# Altium schematic sheet XilinxPower.SchDoc
size A3; Organization: Altium Limited; Address1: L3, 12a Rodborough Rd; Address2: Frenchs Forest; Address3: NSW; Address4: Australia 2086
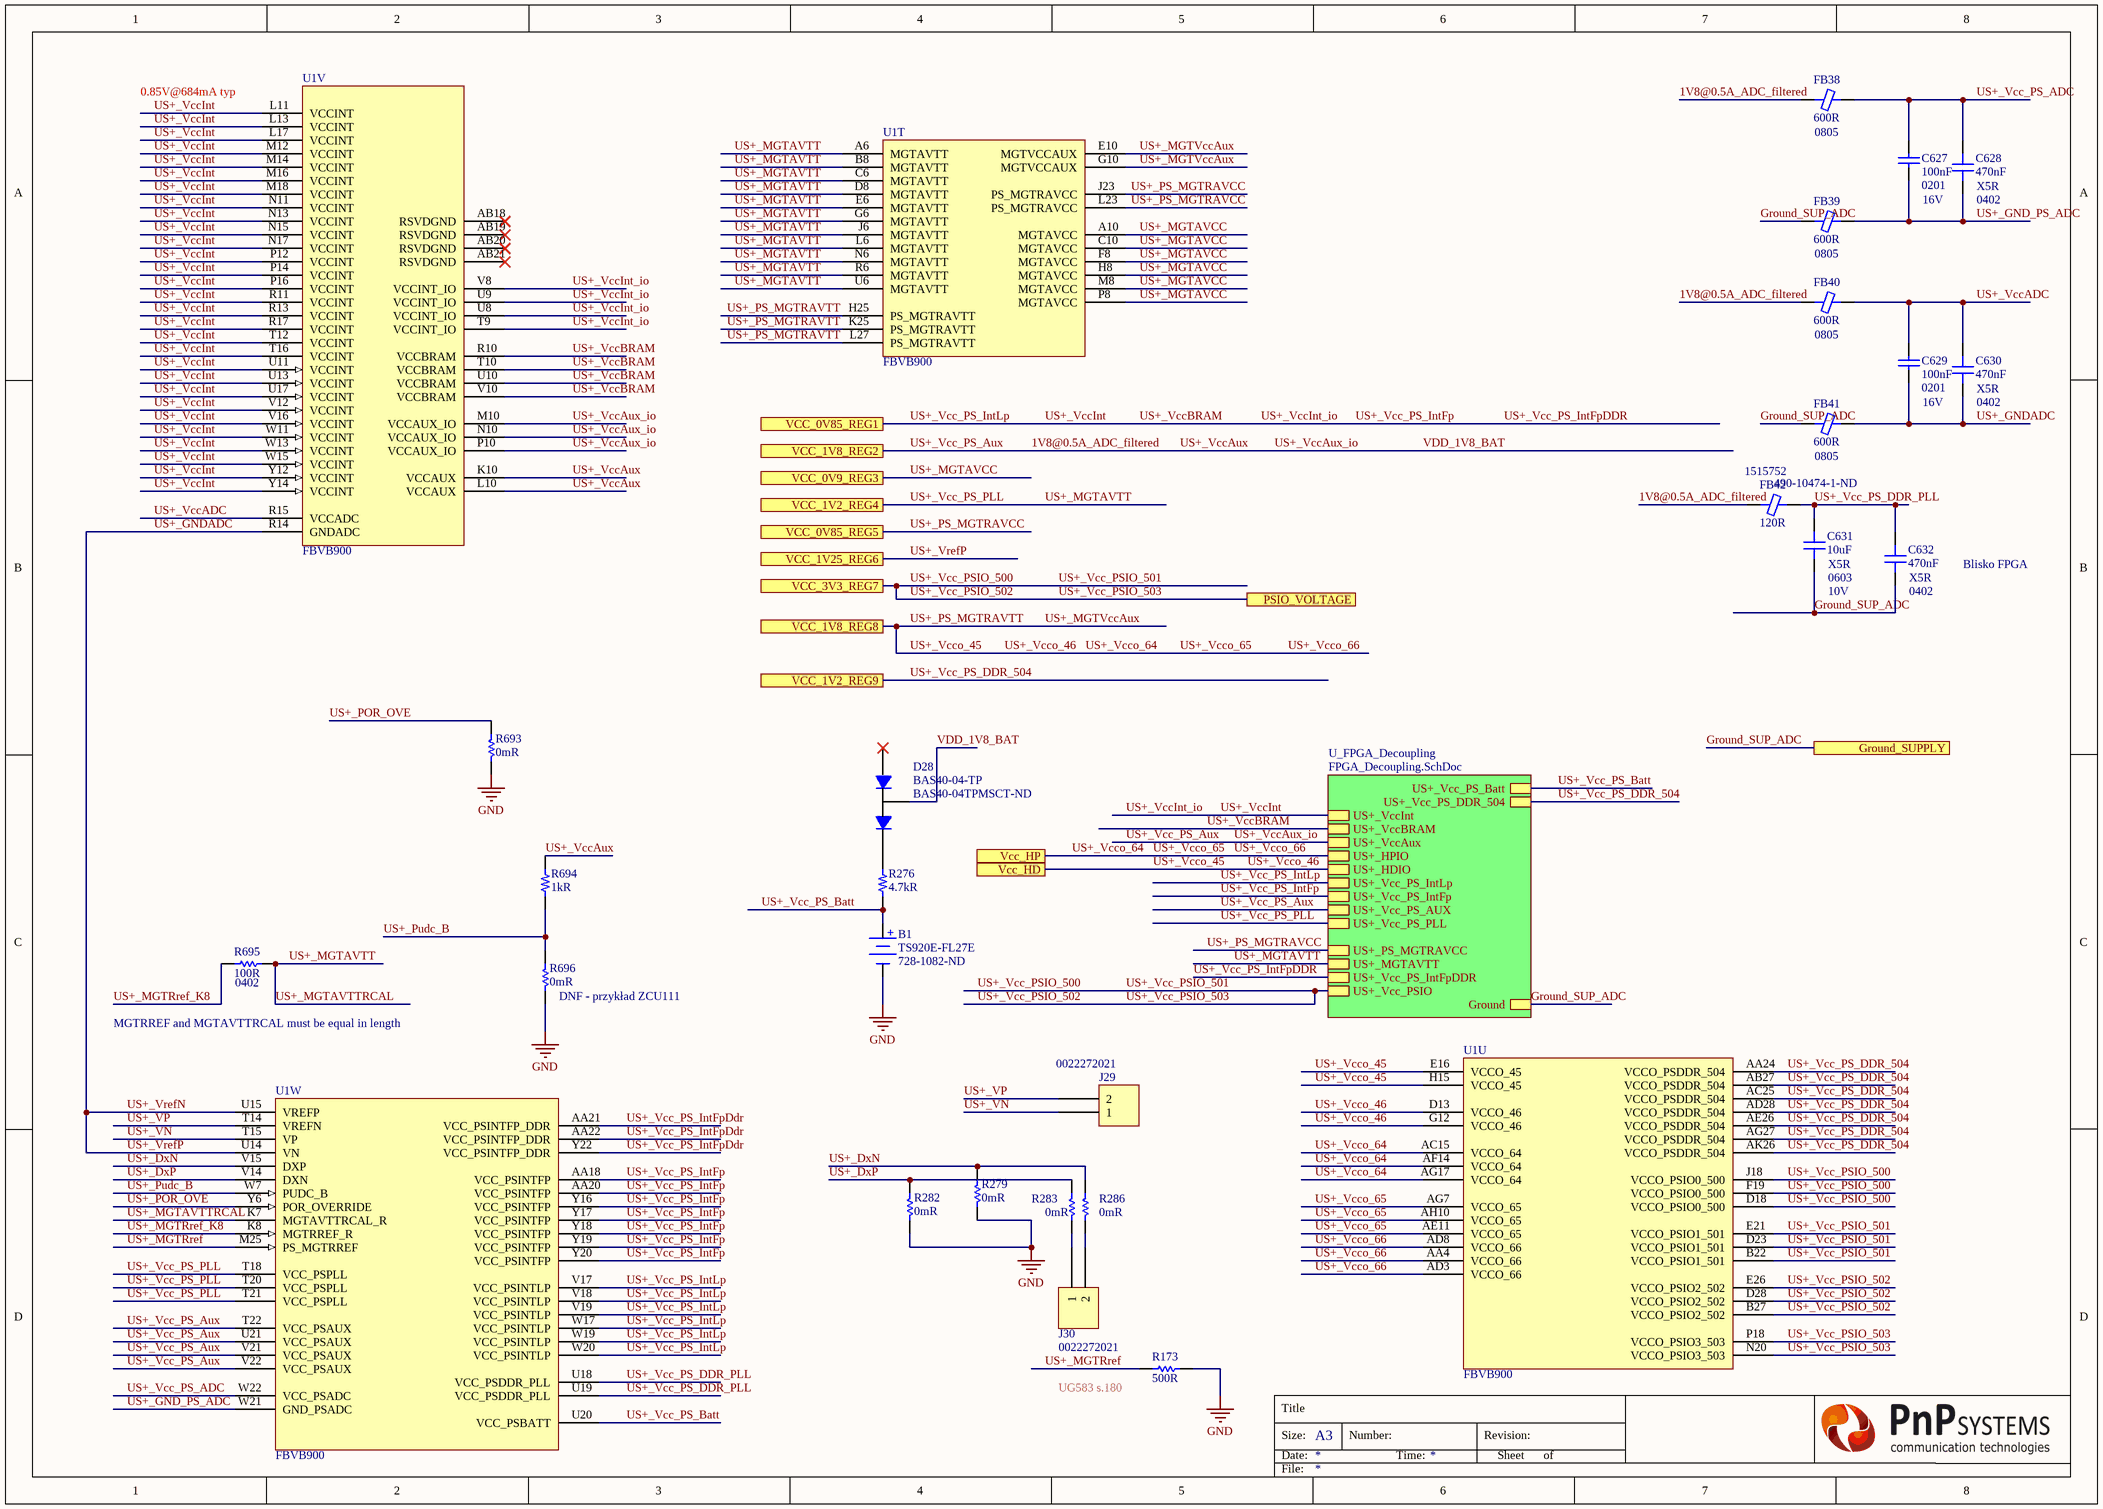
[diagram p0: XilinxPower.SchDoc]

## Parts
B1  TS920E-FL27E  Supplier Part Number 1: 728-1082-ND  [Battery]
C627  100nF  Case/Package: 0201  Voltage Rating: 16V  [CAP 0201/0603 KK]
C628  470nF  Case/Package: 0402  Dielectric: X5R  [CAP 0402/1005 KK]
C629  100nF  Case/Package: 0201  Voltage Rating: 16V  [CAP 0201/0603 KK]
C630  470nF  Case/Package: 0402  Dielectric: X5R  [CAP 0402/1005 KK]
C631  10uF  Supplier Part Number 1: 490-10474-1-ND  Case/Package: 0603  Dielectric: X5R  Voltage Rating: 10V  [CAP 0603/1608 RF]
C632  470nF  Case/Package: 0402  Dielectric: X5R  [CAP 0402/1005 KK]
D28  BAS40-04-TP  Supplier Part Number 1: BAS40-04TPMSCT-ND  [BAS40-04-TP]
FB38  600R  Case/Package: 0805  [FER 0805/2012]
FB39  600R  Case/Package: 0805  [FER 0805/2012]
FB40  600R  Case/Package: 0805  [FER 0805/2012]
FB41  600R  Case/Package: 0805  [FER 0805/2012]
FB42  120R  Supplier Part Number 1: 1515752  [FER 0603/1608]
J29  Supplier Part Number 1: 0022272021  [MOLEX KK 0022272021]  (hidden comment: SYSMON_VP_VN)
J30  Supplier Part Number 1: 0022272021  [MOLEX KK 0022272021]  (hidden comment: SYSMON_VP_VN)
R173  500R  [RES 0402/1005 RF KK]
R276  4.7kR  [RES 0402/1005 RF KK]
R279  0mR  [RES 0402/1005 RF KK]
R282  0mR  [RES 0402/1005 RF KK]
R283  0mR  [RES 0402/1005 RF KK]
R286  0mR  [RES 0402/1005 RF KK]
R693  0mR  [RES 0402/1005 RF KK]
R694  1kR  [RES 0402/1005 RF KK]
R695  100R  Case/Package: 0402  [RES 0402/1005 RF KK]
R696  0mR  [RES 0402/1005 RF KK]
U1  FBVB900  [FBVB900 XX]  (parts T,U,V,W of 23)

## Sub-sheets
U_FPGA_Decoupling = FPGA_Decoupling.SchDoc: US+_VccInt, US+_VccBRAM, Ground, US+_VccAux, US+_HPIO, US+_HDIO, US+_Vcc_PS_IntLp, US+_PS_MGTRAVCC, US+_MGTAVTT, US+_Vcc_PS_IntFp, US+_Vcc_PS_AUX, US+_Vcc_PS_PLL, US+_Vcc_PSIO, US+_Vcc_PS_Batt, US+_Vcc_PS_DDR_504, US+_Vcc_PS_IntFpDDR

## Ports
Ground_SUPPLY, PSIO_VOLTAGE, VCC_0V9_REG3, VCC_0V85_REG1, VCC_0V85_REG5, VCC_1V2_REG4, VCC_1V2_REG9, VCC_1V8_REG2, VCC_1V8_REG8, VCC_1V25_REG6, VCC_3V3_REG7, Vcc_HD, Vcc_HP

## Nets
GND: B1.2(-) R173.2 R279.2 R282.2 R693.2 R696.2
1V8@0.5A_ADC_filtered: D28.3 FB38.1 FB40.1 FB42.1 R694.1 U1.K10(VCCAUX) U1.L10(VCCAUX) U1.M10(VCCAUX_IO) U1.N10(VCCAUX_IO) U1.P10(VCCAUX_IO) U1.T22(VCC_PSAUX) U1.U21(VCC_PSAUX) U1.V21(VCC_PSAUX) U1.V22(VCC_PSAUX) ; port VCC_1V8_REG2, sheet U_FPGA_Decoupling/US+_VccAux, sheet U_FPGA_Decoupling/US+_Vcc_PS_AUX  [also labelled US+_Vcc_PS_Aux, US+_VccAux, US+_VccAux_io, VDD_1V8_BAT]
Ground_SUP_ADC: C631.1 C632.1 FB39.1 FB41.1 ; port Ground_SUPPLY, sheet U_FPGA_Decoupling/Ground
US+_DxN: R279.1 R286.1 U1.V15(DXP)
US+_DxP: R282.1 R283.1 U1.V14(DXN)
US+_GND_PS_ADC: C627.1 C628.1 FB39.2 U1.W21(GND_PSADC)
US+_GNDADC: C629.1 C630.1 FB41.2 U1.R14(GNDADC) U1.U14(VN) U1.U15(VREFP) ; port VCC_1V25_REG6  [also labelled US+_VrefN, US+_VrefP]
US+_MGTAVCC: U1.A10(MGTAVCC) U1.C10(MGTAVCC) U1.F8(MGTAVCC) U1.H8(MGTAVCC) U1.M8(MGTAVCC) U1.P8(MGTAVCC) ; port VCC_0V9_REG3
US+_MGTAVTT: R695.2 U1.A6(MGTAVTT) U1.B8(MGTAVTT) U1.C6(MGTAVTT) U1.D8(MGTAVTT) U1.E6(MGTAVTT) U1.G6(MGTAVTT) U1.J6(MGTAVTT) U1.K7(MGTAVTTRCAL_R) U1.L6(MGTAVTT) U1.N6(MGTAVTT) U1.R6(MGTAVTT) U1.T18(VCC_PSPLL) U1.T20(VCC_PSPLL) U1.T21(VCC_PSPLL) U1.U6(MGTAVTT) ; port VCC_1V2_REG4, sheet U_FPGA_Decoupling/US+_MGTAVTT, sheet U_FPGA_Decoupling/US+_Vcc_PS_PLL  [also labelled US+_MGTAVTTRCAL, US+_Vcc_PS_PLL]
US+_MGTRref: R173.1 U1.M25(PS_MGTRREF)
US+_MGTRref_K8: R695.1 U1.K8(MGTRREF_R)
US+_MGTVccAux: U1.AA4(VCCO_66) U1.AC15(VCCO_64) U1.AD3(VCCO_66) U1.AD8(VCCO_66) U1.AE11(VCCO_65) U1.AF14(VCCO_64) U1.AG7(VCCO_65) U1.AG17(VCCO_64) U1.AH10(VCCO_65) U1.D13(VCCO_46) U1.E10(MGTVCCAUX) U1.E16(VCCO_45) U1.G10(MGTVCCAUX) U1.G12(VCCO_46) U1.H15(VCCO_45) U1.H25(PS_MGTRAVTT) U1.K25(PS_MGTRAVTT) U1.L27(PS_MGTRAVTT) ; port VCC_1V8_REG8, port Vcc_HP, port Vcc_HD, sheet U_FPGA_Decoupling/US+_HPIO, sheet U_FPGA_Decoupling/US+_HDIO  [also labelled US+_PS_MGTRAVTT, US+_Vcco_45, US+_Vcco_46, US+_Vcco_64, US+_Vcco_65, US+_Vcco_66]
US+_POR_OVE: R693.1 U1.Y6(POR_OVERRIDE)
US+_PS_MGTRAVCC: U1.J23(PS_MGTRAVCC) U1.L23(PS_MGTRAVCC) ; port VCC_0V85_REG5, sheet U_FPGA_Decoupling/US+_PS_MGTRAVCC
US+_Pudc_B: R694.2 R696.1 U1.W7(PUDC_B)
US+_Vcc_PS_ADC: C627.2 C628.2 FB38.2 U1.W22(VCC_PSADC)
US+_Vcc_PS_Batt: B1.1(+) R276.1 U1.U20(VCC_PSBATT) ; sheet U_FPGA_Decoupling/US+_Vcc_PS_Batt
US+_Vcc_PS_DDR_504: U1.AA24(VCCO_PSDDR_504) U1.AB27(VCCO_PSDDR_504) U1.AC25(VCCO_PSDDR_504) U1.AD28(VCCO_PSDDR_504) U1.AE26(VCCO_PSDDR_504) U1.AG27(VCCO_PSDDR_504) U1.AK26(VCCO_PSDDR_504) ; port VCC_1V2_REG9, sheet U_FPGA_Decoupling/US+_Vcc_PS_DDR_504
US+_Vcc_PS_DDR_PLL: C631.2 C632.2 FB42.2 U1.U18(VCC_PSDDR_PLL) U1.U19(VCC_PSDDR_PLL)
US+_Vcc_PS_IntFp: U1.AA18(VCC_PSINTFP) U1.AA20(VCC_PSINTFP) U1.AA21(VCC_PSINTFP_DDR) U1.AA22(VCC_PSINTFP_DDR) U1.L11(VCCINT) U1.L13(VCCINT) U1.L17(VCCINT) U1.M12(VCCINT) U1.M14(VCCINT) U1.M16(VCCINT) U1.M18(VCCINT) U1.N11(VCCINT) U1.N13(VCCINT) U1.N15(VCCINT) U1.N17(VCCINT) U1.P12(VCCINT) U1.P14(VCCINT) U1.P16(VCCINT) U1.R10(VCCBRAM) U1.R11(VCCINT) U1.R13(VCCINT) U1.R17(VCCINT) U1.T9(VCCINT_IO) U1.T10(VCCBRAM) U1.T12(VCCINT) U1.T16(VCCINT) U1.U8(VCCINT_IO) U1.U9(VCCINT_IO) U1.U10(VCCBRAM) U1.U11(VCCINT) U1.U13(VCCINT) U1.U17(VCCINT) U1.V8(VCCINT_IO) U1.V10(VCCBRAM) U1.V12(VCCINT) U1.V16(VCCINT) U1.V17(VCC_PSINTLP) U1.V18(VCC_PSINTLP) U1.V19(VCC_PSINTLP) U1.W11(VCCINT) U1.W13(VCCINT) U1.W15(VCCINT) U1.W17(VCC_PSINTLP) U1.W19(VCC_PSINTLP) U1.W20(VCC_PSINTLP) U1.Y12(VCCINT) U1.Y14(VCCINT) U1.Y16(VCC_PSINTFP) U1.Y17(VCC_PSINTFP) U1.Y18(VCC_PSINTFP) U1.Y19(VCC_PSINTFP) U1.Y20(VCC_PSINTFP) U1.Y22(VCC_PSINTFP_DDR) ; port VCC_0V85_REG1, sheet U_FPGA_Decoupling/US+_VccInt, sheet U_FPGA_Decoupling/US+_VccBRAM, sheet U_FPGA_Decoupling/US+_Vcc_PS_IntLp, sheet U_FPGA_Decoupling/US+_Vcc_PS_IntFp, sheet U_FPGA_Decoupling/US+_Vcc_PS_IntFpDDR  [also labelled US+_Vcc_PS_IntFpDdr, US+_Vcc_PS_IntLp, US+_VccBRAM, US+_VccInt, US+_VccInt_io]
US+_Vcc_PSIO_500: U1.B22(VCCO_PSIO1_501) U1.B27(VCCO_PSIO2_502) U1.D18(VCCO_PSIO0_500) U1.D23(VCCO_PSIO1_501) U1.D28(VCCO_PSIO2_502) U1.E21(VCCO_PSIO1_501) U1.E26(VCCO_PSIO2_502) U1.F19(VCCO_PSIO0_500) U1.J18(VCCO_PSIO0_500) U1.N20(VCCO_PSIO3_503) U1.P18(VCCO_PSIO3_503) ; port PSIO_VOLTAGE, port VCC_3V3_REG7, sheet U_FPGA_Decoupling/US+_Vcc_PSIO  [also labelled US+_Vcc_PSIO_501, US+_Vcc_PSIO_502, US+_Vcc_PSIO_503]
US+_VccADC: C629.2 C630.2 FB40.2 U1.R15(VCCADC)
US+_VN: J29.1 U1.T15(VP)
US+_VP: J29.2 U1.T14(VREFN)
NetD28_2: D28.2(K) R276.2
NetJ30_1: J30.1 R283.2
NetJ30_2: J30.2 R286.2

Not connected (* = marked no-connect by the designer): D28 1(A)*; U1 AB18(RSVDGND)* AB19(RSVDGND)* AB20(RSVDGND)* AB21(RSVDGND)*

## Notes on the sheet
- 0.85V@684mA typ
- Blisko FPGA
- MGTRREF and MGTAVTTRCAL must be equal in length
- (near R696) DNF - przykład ZCU111
- (near R173) UG583 s.180
- Title
- Size:
- Date:
- A3
- Number:
- Time:
- Revision:
- Sheet
- of
- File:

## Library data of the parts
B1 = TS920E-FL27E: BATT LITH 1.5V 5.5MAH COIN 9.5MM; Manufacturer: Seiko; Supplier 1: Digi-Key; Manufacturer Part Number: TS920E-FL27E; Stock 1: 517; Pricing 1: 1 = 3,09000, 10 = 2,55800, 50 = 2,25540, 100 = 2,12940, 250 = 1,97820, 500 = 1,87740, 1000 = 1,77660, 2500 = 1,68840 (USD); RoHS: Yes; Weight: 0.45g; Capacity: 5.5mAh; Voltage Rating: 1.5V; Termination: SMD/SMT; Height: 0.08inch; ComponentLink1URL: https://media.digikey.com/pdf/Data%20Sheets/Seiko%20Instruments%20PDFs/TS920E.pdf?src-supplier=Digi-Key; ComponentLink1Description: https://media.digikey.com/pdf/Data%20Sheets/Seiko%20Instruments%20PDFs/TS920E.pdf?src-supplier=Digi-Key
C627 C629 = Capacitor: CAP CER 0.1UF 16V X5R 0201; Manufacturer: Murata; Manufacturer Part Number: GRM033R61C104ME84D; Tolerance: 20%; Supplier 1: Digi-Key; Supplier Part Number 1: 490-9986-1-ND; RoHS: Yes; Category: Ceramic Capacitors; Stock 1: 519119; Pricing 1: 1=0,10000, 10=0,06000, 100=0,02670, 500=0,01906, 1000=0,01497, 2500=0,01361, 5000=0,01252 (USD); Mount: Surface Mount; Weight: 1.2E-05oz; Case Code (Metric): 0603; Case Code (Imperial): 0201; Min Operating Temperature: -55°C; Max Operating Temperature: 85°C; Capacitance: 100nF; Packaging: Tape and Reel; Dielectric: X5R; Termination: SMD/SMT; Voltage Rating (DC): 16V; Package Quantity: 15000; Length: 0.024inch; Height: 0.3mm; Width: 0.3mm; Thickness: 0.013inch; ComponentLink1URL: http://www.mouser.com/ds/2/281/c02e-2905.pdf?src-supplier=Mouser; ComponentLink1Description: http://www.mouser.com/ds/2/281/c02e-2905.pdf?src-supplier=Mouser; ComponentLink2URL: http://search.murata.co.jp/Ceramy/image/img/A01X/G101/ENG/GRM033R61C104ME84-01.pdf?src-supplier=Digi-Key; ComponentLink2Description: http://search.murata.co.jp/Ceramy/image/img/A01X/G101/ENG/GRM033R61C104ME84-01.pdf?src-supplier=Digi-Key
C628 C630 C632 = Capacitor: Manufacturer: Samsung; Manufacturer Part Number: CL05A474KP5NNNC; Tolerance: 10%; Voltage Rating: 10V; Supplier 1: Digi-Key; Supplier Part Number 1: 1276-1173-1-ND; Stock 1: 941442; Pricing 1: 1 = 0,10000, 10 = 0,07000, 100 = 0,03140, 500 = 0,02240, 1000 = 0,01761, 2500 = 0,01600, 5000 = 0,01472 (USD); RoHS: Yes; Mount: Surface Mount; Case Code (Metric): 1005; Case Code (Imperial): 0402; Min Operating Temperature: -55°C; Max Operating Temperature: 85°C; Capacitance: 470nF; Packaging: Tape and Reel; Voltage Rating (DC): 10V; Length: 1mm; Height: 0.5mm; Width: 0.02inch; Thickness: 0.022inch; Depth: 0.5mm; Radiation Hardening: No; Lead Free: Lead Free; ComponentLink1URL: https://datasheet.ciiva.com/25710/cl05a474kp5nnnc-25710324.pdf?src-supplier=Digi-Key; ComponentLink1Description: https://datasheet.ciiva.com/25710/cl05a474kp5nnnc-25710324.pdf?src-supplier=Digi-Key; ComponentLink2URL: https://datasheet.ciiva.com/26838/getdatasheetpartid-355286-26838191.pdf?src-supplier=Verical; ComponentLink2Description: https://datasheet.ciiva.com/26838/getdatasheetpartid-355286-26838191.pdf?src-supplier=Verical; ComponentLink3URL: https://datasheet.ciiva.com/16437/cl05b104kq5nnnc-16437351.pdf?src-supplier=Future+Electronics; ComponentLink3Description: https://datasheet.ciiva.com/16437/cl05b104kq5nnnc-16437351.pdf?src-supplier=Future+Electronics
C631 = Capacitor: Manufacturer: Murata; Manufacturer Part Number: GRM188R61A106KE69D; Tolerance: 10%; Supplier 1: Digi-Key; Stock 1: 4597169; Pricing 1: 1 = 0,21000, 10 = 0,14000, 100 = 0,07110, 500 = 0,04864, 1000 = 0,04303 (USD); RoHS: Yes; Mount: Surface Mount; Case Code (Metric): 1608; Case Code (Imperial): 0603; Min Operating Temperature: -55°C; Max Operating Temperature: 85°C; Capacitance: 10uF; Packaging: Tape and Reel; Voltage: 10V; Voltage Rating (DC): 10V; Length: 1.6mm; Height: 0.8mm; Width: 0.031inch; Thickness: 0.037inch; Depth: 0.8mm; REACH SVHC: No SVHC; Lead Free: Lead Free; ComponentLink1URL: http://components.arrow.com/part/dataview/0323_07281717?src-supplier=Arrow+Europe; ComponentLink1Description: http://components.arrow.com/part/dataview/0323_07281717?src-supplier=Arrow+Europe; ComponentLink2URL: http://www.farnell.com/datasheets/1955682.pdf?src-supplier=Farnell; ComponentLink2Description: http://www.farnell.com/datasheets/1955682.pdf?src-supplier=Farnell; ComponentLink3URL: http://www.mouser.com/ds/2/281/c02e-2905.pdf?src-supplier=Mouser; ComponentLink3Description: http://www.mouser.com/ds/2/281/c02e-2905.pdf?src-supplier=Mouser; ComponentLink4URL: http://search.murata.co.jp/Ceramy/image/img/A01X/G101/ENG/GRM188R61A106KE69-01.pdf?src-supplier=Digi-Key; ComponentLink4Description: http://search.murata.co.jp/Ceramy/image/img/A01X/G101/ENG/GRM188R61A106KE69-01.pdf?src-supplier=Digi-Key; ComponentLink5URL: http://www.farnell.com/datasheets/1955682.pdf?src-supplier=Element14; ComponentLink5Description: http://www.farnell.com/datasheets/1955682.pdf?src-supplier=Element14; ComponentLink6URL: http://www.farnell.com/datasheets/1955682.pdf?src-supplier=Newark; ComponentLink6Description: http://www.farnell.com/datasheets/1955682.pdf?src-supplier=Newark; ComponentLink7URL: http://psearch.en.murata.com/capacitor/product/GRM188R61A106KE69%23.pdf?src-supplier=Avnet; ComponentLink7Description: http://psearch.en.murata.com/capacitor/product/GRM188R61A106KE69%23.pdf?src-supplier=Avnet
D28 = BAS40-04-TP: DIODE ARRAY SCHOTTKY 40V SOT23; Manufacturer: MCC; Max Surge Current: 600mA; Recovery Time: 5ns; Forward Current: 200mA; Forward Voltage: 1V; Max Reverse Leakage Current: 200nA; Power Dissipation: 200mW; Capacitance: 5pF; Element Configuration: Single; Supplier 1: Digi-Key; Manufacturer Part Number: BAS40-04-TP; Stock 1: 1204011; Pricing 1: 1 = 0,39000, 10 = 0,28800, 25 = 0,25240, 100 = 0,13700, 250 = 0,13628, 500 = 0,11176, 1000 = 0,08292 (USD); RoHS: Yes; Mount: Surface Mount; Case/Package: SOT-23; Number of Pins: 3; Min Operating Temperature: -55°C; Max Operating Temperature: 125°C; Package Quantity: 3000; Packaging: Tape and Reel; Average Rectified Current: 200mA; Reverse Recovery Time: 5ns; Max Forward Surge Current (Ifsm): 600mA; Peak Reverse Current: 200nA; Max Repetitive Reverse Voltage (Vrrm): 40V; Peak Non-Repetitive Surge Current: 600mA; Max Reverse Voltage (DC): 40V; Length: 3.04mm; Height: 1.02mm; Width: 1.4mm; Radiation Hardening: No; REACH SVHC: Unknown; Lead Free: Lead Free; ComponentLink1URL: https://datasheet.ciiva.com/23684/1684803-23684306.pdf?src-supplier=Newark; ComponentLink1Description: https://datasheet.ciiva.com/23684/1684803-23684306.pdf?src-supplier=Newark; ComponentLink2URL: https://datasheet.ciiva.com/4716/bas40-bas70sot-23-28891-4716000.pdf?src-supplier=Mouser; ComponentLink2Description: https://datasheet.ciiva.com/4716/bas40-bas70sot-23-28891-4716000.pdf?src-supplier=Mouser; ComponentLink3URL: https://datasheet.ciiva.com/906/bas40-bas70sot-23-906320.pdf?src-supplier=Digi-Key; ComponentLink3Description: https://datasheet.ciiva.com/906/bas40-bas70sot-23-906320.pdf?src-supplier=Digi-Key; ComponentLink4URL: https://datasheet.ciiva.com/15200/getdatasheetpartid-226544-15200426.pdf?src-supplier=Verical; ComponentLink4Description: https://datasheet.ciiva.com/15200/getdatasheetpartid-226544-15200426.pdf?src-supplier=Verical; ComponentLink5URL: https://datasheet.ciiva.com/7624/1684803-7624699.pdf?src-supplier=Element14; ComponentLink5Description: https://datasheet.ciiva.com/7624/1684803-7624699.pdf?src-supplier=Element14; ComponentLink6URL: https://datasheet.ciiva.com/906/bas40-bas70sot-23-906318.pdf?src-supplier=Digi-Key; ComponentLink6Description: https://datasheet.ciiva.com/906/bas40-bas70sot-23-906318.pdf?src-supplier=Digi-Key; ComponentLink7URL: https://datasheet.ciiva.com/906/bas40-bas70sot-23-906319.pdf?src-supplier=Digi-Key; ComponentLink7Description: https://datasheet.ciiva.com/906/bas40-bas70sot-23-906319.pdf?src-supplier=Digi-Key
FB38-FB41 = Ferrite: FERRITE BEAD 600 OHM 0805 1LN; Manufacturer: Laird; Manufacturer Part Number: HZ0805E601R-10; Current Rating: 500mA; Number of Lines: 1; DC Resistance (DCR): 300mR; Test Frequency: 100MHz; Supplier 1: Digi-Key; Supplier Part Number 1: 240-2399-1-ND; RoHS: Yes; Category: Fixed Inductors; Stock 1: 2783878; Pricing 1: 1=0,18000, 10=0,14400, 25=0,11200, 50=0,09280, 100=0,07990, 250=0,06396, 500=0,05754, 1000=0,04796 (USD); Mount: Surface Mount; Weight: 0.00392oz; Case Code (Metric): 2012; Case Code (Imperial): 0805; Material: Ferrite; Contact Plating: Tin,Matte; Core Material: Ferrite; Min Operating Temperature: -40°C; Max Operating Temperature: 125°C; Package Quantity: 1; Packaging: Tape and Reel; Impedance: 600R; Max Current Rating: 500mA; Max DC Current: 500mA; Termination: SMD/SMT; Frequency: 100MHz; Length: 2mm; Height: 1.25mm; Width: 0.049inch; Depth: 1.45mm; REACH SVHC: Unknown; Lead Free: Lead Free; ComponentLink1URL: https://datasheet.ciiva.com/22622/1685710-22622833.pdf?src-supplier=Element14; ComponentLink1Description: https://datasheet.ciiva.com/22622/1685710-22622833.pdf?src-supplier=Element14; ComponentLink2URL: https://datasheet.ciiva.com/1013/hz0805e601r-10-1013170.pdf?src-supplier=Digi-Key; ComponentLink2Description: https://datasheet.ciiva.com/1013/hz0805e601r-10-1013170.pdf?src-supplier=Digi-Key; ComponentLink3URL: https://datasheet.ciiva.com/8512/hz0805e601r-10-a-vp-8512772.pdf?src-supplier=Avnet; ComponentLink3Description: https://datasheet.ciiva.com/8512/hz0805e601r-10-a-vp-8512772.pdf?src-supplier=Avnet; ComponentLink4URL: https://datasheet.ciiva.com/16714/70065439-16714006.pdf?src-supplier=Allied+Electronics; ComponentLink4Description: https://datasheet.ciiva.com/16714/70065439-16714006.pdf?src-supplier=Allied+Electronics
FB42 = Ferrite: Ind Chip Bead 120Ohm 25% 100MHz Ferrite 3A 0603 Paper T/R; Manufacturer: Murata; Manufacturer Part Number: BLM18SG121TN1D; Material: Steel,Ferrite; DC Resistance (DCR): 25mR; Number of Circuits: 1; Shielding: Unshielded; Supplier 1: Farnell; RoHS: Yes; Category: Ferrite Beads and Chips; Stock 1: 47191; Case/Package: 0603; Number of Pins: 2; Core Material: Ferrite; Case Code (Metric): 1608; Case Code (Imperial): 0603; Min Operating Temperature: -55°C; Max Operating Temperature: 125°C; Impedance: 120R; Packaging: Tape and Reel; Current Rating: 3A; Tolerance: 25%; Max DC Current: 3A; Package Quantity: 1; Max Current Rating: 3A; Number of Lines: 1; Termination: SMD/SMT; Test Frequency: 100MHz; Frequency: 100MHz; Length: 1.6mm; Height: 0.8mm; Width: 0.8mm; Depth: 0.8mm; REACH SVHC: No SVHC; Lead Free: Lead Free; ComponentLink1URL: https://datasheet.ciiva.com/1012/l0110s0100blm18s-1012624.pdf?src-supplier=Digi-Key; ComponentLink1Description: https://datasheet.ciiva.com/1012/l0110s0100blm18s-1012624.pdf?src-supplier=Digi-Key; ComponentLink2URL: https://datasheet.ciiva.com/18093/getdatasheetpartid-295885-18093249.pdf?src-supplier=Verical; ComponentLink2Description: https://datasheet.ciiva.com/18093/getdatasheetpartid-295885-18093249.pdf?src-supplier=Verical; ComponentLink3URL: https://datasheet.ciiva.com/11799/0900766b811b5866-11799181.pdf?src-supplier=RSComponents; ComponentLink3Description: https://datasheet.ciiva.com/11799/0900766b811b5866-11799181.pdf?src-supplier=RSComponents; ComponentLink4URL: https://datasheet.ciiva.com/41449/001171723-da-01-en-chip-drossel0603-120r-3000ma-1-6x0-8mm-41449353.pdf?src-supplier=Conrad; ComponentLink4Description: https://datasheet.ciiva.com/41449/001171723-da-01-en-chip-drossel0603-120r-3000ma-1-6x0-8mm-41449353.pdf?src-supplier=Conrad; ComponentLink5URL: https://datasheet.ciiva.com/41449/001172312-da-01-en-drossel-0603-120r-1-6x0-8mm-10000st-41449675.pdf?src-supplier=Conrad; ComponentLink5Description: https://datasheet.ciiva.com/41449/001172312-da-01-en-drossel-0603-120r-1-6x0-8mm-10000st-41449675.pdf?src-supplier=Conrad; ComponentLink6URL: https://datasheet.ciiva.com/1012/l0110s0100blm18s-1012625.pdf?src-supplier=Digi-Key; ComponentLink6Description: https://datasheet.ciiva.com/1012/l0110s0100blm18s-1012625.pdf?src-supplier=Digi-Key; ComponentLink7URL: https://datasheet.ciiva.com/8021/5151-8021511.pdf?src-supplier=Element14; ComponentLink7Description: https://datasheet.ciiva.com/8021/5151-8021511.pdf?src-supplier=Element14; ComponentLink8URL: https://datasheet.ciiva.com/8021/5151-8021512.pdf?src-supplier=Element14; ComponentLink8Description: https://datasheet.ciiva.com/8021/5151-8021512.pdf?src-supplier=Element14; ComponentLink9URL: https://datasheet.ciiva.com/14122/blm-series-eng-tds-14122906.pdf?src-supplier=Distrelec; ComponentLink9Description: https://datasheet.ciiva.com/14122/blm-series-eng-tds-14122906.pdf?src-supplier=Distrelec; ComponentLink10URL: https://datasheet.ciiva.com/16395/l0110s0100blm18s-16395498.pdf?src-supplier=Future+Electronics; ComponentLink10Description: https://datasheet.ciiva.com/16395/l0110s0100blm18s-16395498.pdf?src-supplier=Future+Electronics; ComponentLink11URL: https://datasheet.ciiva.com/1012/l0110s0100blm18s-1012623.pdf?src-supplier=Digi-Key; ComponentLink11Description: https://datasheet.ciiva.com/1012/l0110s0100blm18s-1012623.pdf?src-supplier=Digi-Key; ComponentLink12URL: https://datasheet.ciiva.com/17246/l0110s0100blm18s-17246943.pdf?src-supplier=Avnet+Europe; ComponentLink12Description: https://datasheet.ciiva.com/17246/l0110s0100blm18s-17246943.pdf?src-supplier=Avnet+Europe
J29 J30 = 2 Pin: Manufacturer: Molex; Number of Positions: 2; Contact Resistance: 20mR; Current Rating: 4A; Voltage Rating: 250V; Gender: Male; Insulation Resistance: 50GR; Pitch: 2.54mm; Approvals: UL,CSA; Supplier 1: Avnet; Manufacturer Part Number: 22-27-2021; RoHS: Yes; Category: Headers and Wire Housings; Stock 1: 3474; Pricing 1: 1=0,12370, 10=0,11289, 30=0,10755, 50=0,10087, 100=0,09486 (USD); Mount: Through Hole; Housing Color: Natural; Color: White; Housing Material: Nylon; Contact Plating: Tin,Copper; Contact Material: Brass,Tin; Material: Nylon; Min Operating Temperature: 0°C; Max Operating Temperature: 75°C; Orientation: Straight; Termination: Solder; Number of Rows: 1; Packaging: Bulk; Number of Contacts: 2; Number of Circuits: 2; Package Quantity: 24000; Contact Gender: Male; Voltage Rating (DC): 250V; Working Voltage: 250V; Voltage Rating (AC): 250V; Max Current Rating: 4A; Length: 10.16mm; Height: 11.7mm; Depth: 5.8mm; Lead Pitch: 2.54mm; Radiation Hardening: No; Lead Free: Lead Free; Flammability Rating: UL94 V-0; REACH SVHC: Unknown; ComponentLink1URL: https://datasheet.ciiva.com/9468/0022272021-pcb-headers-9468403.pdf?src-supplier=Avnet; ComponentLink1Description: https://datasheet.ciiva.com/9468/0022272021-pcb-headers-9468403.pdf?src-supplier=Avnet; ComponentLink2URL: https://datasheet.ciiva.com/30177/113940022272021-pcb-headers-30177601.pdf?src-supplier=Onlinecomponents.com; ComponentLink2Description: https://datasheet.ciiva.com/30177/113940022272021-pcb-headers-30177601.pdf?src-supplier=Onlinecomponents.com; ComponentLink3URL: https://datasheet.ciiva.com/15217/getdatasheetpartid-163454-15217683.pdf?src-supplier=Verical; ComponentLink3Description: https://datasheet.ciiva.com/15217/getdatasheetpartid-163454-15217683.pdf?src-supplier=Verical; ComponentLink4URL: https://datasheet.ciiva.com/5154/0022272021-pcb-headers-227458-5154933.pdf?src-supplier=Mouser; ComponentLink4Description: https://datasheet.ciiva.com/5154/0022272021-pcb-headers-227458-5154933.pdf?src-supplier=Mouser; ComponentLink5URL: https://datasheet.ciiva.com/11746/0900766b804624e4-11746551.pdf?src-supplier=RSComponents; ComponentLink5Description: https://datasheet.ciiva.com/11746/0900766b804624e4-11746551.pdf?src-supplier=RSComponents; ComponentLink6URL: https://datasheet.ciiva.com/19462/879254-19462349.pdf?src-supplier=Jameco; ComponentLink6Description: https://datasheet.ciiva.com/19462/879254-19462349.pdf?src-supplier=Jameco; ComponentLink7URL: https://datasheet.ciiva.com/25908/0022272021-pcb-headers-25908245.pdf?src-supplier=Avnet+Europe; ComponentLink7Description: https://datasheet.ciiva.com/25908/0022272021-pcb-headers-25908245.pdf?src-supplier=Avnet+Europe; ComponentLink8URL: https://datasheet.ciiva.com/20207/22-0838e-20207111.pdf?src-supplier=Rapid+Electronics; ComponentLink8Description: https://datasheet.ciiva.com/20207/22-0838e-20207111.pdf?src-supplier=Rapid+Electronics
R173 = Resistor: RES SMD 500 OHM 0.1% 1/20W 0402; Manufacturer: Vishay Dale; Manufacturer Part Number: PNM0402E5000BST1; Max Power Dissipation: 50mW; Temperature Coefficient: 25ppm/°C; Supplier 1: Digi-Key; Supplier Part Number 1: 541-1905-1-ND; RoHS: Yes; Category: Chip SMD Resistors; Stock 1: 28724; Pricing 1: 1=1,08000, 10=0,95500, 100=0,69300 (USD); Case/Package: 0402; Case Code (Imperial): 0402; Case Code (Metric): 1005; Min Operating Temperature: -55°C; Max Operating Temperature: 155°C; Features: Moisture Resistant,Anti-Sulfur; Resistance: 500R; Tolerance: 0.1%; Package Quantity: 1000; Packaging: Tape and Reel; Composition: Thin Film; Number of Terminations: 2; Length: 0.042inch; Height: 0.033inch; Width: 0.022inch; Lead Free: Lead Free; ComponentLink1URL: https://datasheet.ciiva.com/29717/pnm-29717420.pdf?src-supplier=Digi-Key; ComponentLink1Description: https://datasheet.ciiva.com/29717/pnm-29717420.pdf?src-supplier=Digi-Key; ComponentLink2URL: https://datasheet.ciiva.com/29717/pnm-29717419.pdf?src-supplier=Digi-Key; ComponentLink2Description: https://datasheet.ciiva.com/29717/pnm-29717419.pdf?src-supplier=Digi-Key; ComponentLink3URL: https://datasheet.ciiva.com/29717/pnm-29717421.pdf?src-supplier=Digi-Key; ComponentLink3Description: https://datasheet.ciiva.com/29717/pnm-29717421.pdf?src-supplier=Digi-Key
R276 = Resistor: Manufacturer: Panasonic; Manufacturer Part Number: ERJ-2RKF4701X; Tolerance: 1%; Temperature Coefficient: 100ppm/°C; Power Rating: 100mW; Voltage Rating: 50V; Supplier 1: Digi-Key; Supplier Part Number 1: P4.70KLCT-ND; Stock 1: 5361977; Pricing 1: 1 = 0,10000, 10 = 0,05500, 100 = 0,02250, 1000 = 0,01009, 2500 = 0,00876, 5000 = 0,00724 (USD); RoHS: Yes; Mount: Surface Mount; Case/Package: 0402; Number of Pins: 2; Case Code (Imperial): 0402; Case Code (Metric): 1005; Contact Plating: Tin; Min Operating Temperature: -55°C; Max Operating Temperature: 155°C; Resistance: 4.7kR; Packaging: Tape and Reel; Composition: Thick Film; Package Quantity: 1; Termination: SMD/SMT; Voltage Rating (DC): 50V; Number of Terminations: 2; Military Standard: Not; Max Power Dissipation: 100mW; Features: Automotive AEC-Q200; Length: 1mm; Height: 0.35mm; Width: 0.02inch; Depth: 0.5mm; Radiation Hardening: No; Lead Free: Lead Free; REACH SVHC: No SVHC; ComponentLink1URL: https://datasheet.ciiva.com/11821/0900766b80f80784-11821329.pdf?src-supplier=RSComponents; ComponentLink1Description: https://datasheet.ciiva.com/11821/0900766b80f80784-11821329.pdf?src-supplier=RSComponents; ComponentLink2URL: https://datasheet.ciiva.com/30053/aoa0000ce2-30053990.pdf?src-supplier=Onlinecomponents.com; ComponentLink2Description: https://datasheet.ciiva.com/30053/aoa0000ce2-30053990.pdf?src-supplier=Onlinecomponents.com; ComponentLink3URL: https://datasheet.ciiva.com/7830/aoa0000ce2-7830727.pdf?src-supplier=Element14; ComponentLink3Description: https://datasheet.ciiva.com/7830/aoa0000ce2-7830727.pdf?src-supplier=Element14; ComponentLink4URL: https://datasheet.ciiva.com/22781/1678782-22781576.pdf?src-supplier=Farnell; ComponentLink4Description: https://datasheet.ciiva.com/22781/1678782-22781576.pdf?src-supplier=Farnell; ComponentLink5URL: https://datasheet.ciiva.com/9195/aoa0000ce2-9195737.pdf?src-supplier=Avnet; ComponentLink5Description: https://datasheet.ciiva.com/9195/aoa0000ce2-9195737.pdf?src-supplier=Avnet; ComponentLink6URL: https://datasheet.ciiva.com/17213/aoa0000ce2-17213180.pdf?src-supplier=Avnet+Europe; ComponentLink6Description: https://datasheet.ciiva.com/17213/aoa0000ce2-17213180.pdf?src-supplier=Avnet+Europe; ComponentLink7URL: https://datasheet.ciiva.com/22667/1678782-22667886.pdf?src-supplier=Element14; ComponentLink7Description: https://datasheet.ciiva.com/22667/1678782-22667886.pdf?src-supplier=Element14; ComponentLink8URL: https://datasheet.ciiva.com/16763/70260748-16763151.pdf?src-supplier=Allied+Electronics; ComponentLink8Description: https://datasheet.ciiva.com/16763/70260748-16763151.pdf?src-supplier=Allied+Electronics; ComponentLink9URL: https://datasheet.ciiva.com/22723/1678782-22723903.pdf?src-supplier=Element14; ComponentLink9Description: https://datasheet.ciiva.com/22723/1678782-22723903.pdf?src-supplier=Element14; ComponentLink10URL: https://datasheet.ciiva.com/24025/aoa0000ce2-24025663.pdf?src-supplier=Mouser; ComponentLink10Description: https://datasheet.ciiva.com/24025/aoa0000ce2-24025663.pdf?src-supplier=Mouser
R279 R282 R283 R286 R693 R696 = Resistor: Manufacturer 1: Yageo; Manufacturer Part Number 1: RC0402JR-070RL; Power Rating: 62.5mW; Tolerance: 5%; Voltage Rating: 50V; Max Power Dissipation: 63mW; Temperature Coefficient: 200ppm/°C; Supplier 1: Digi-Key; Supplier Part Number 1: 311-0.0JRCT-ND; Stock 1: 69822252; Pricing 1: 1=0.10000, 10=0.01200, 25=0.00920, 50=0.00680, 100=0.00510, 250=0.00388, 500=0.00308, 1000=0.00227, 5000=0.00163 (USD); RoHS: Yes; Case/Package: 0402; Contact Plating: Tin,Matte; Case Code (Metric): 1005; Case Code (Imperial): 0402; Min Operating Temperature: -55°C; Max Operating Temperature: 155°C; Resistance: 0mR; Packaging: Tape and Reel; Composition: Thick Film; Package Quantity: 1; Number of Terminations: 2; Termination: SMD/SMT; Military Standard: Not; Features: Moisture Resistant; Length: 1mm; Height: 0.016inch; Width: 0.02inch; Depth: 0.5mm; Radiation Hardening: No; REACH SVHC: Unknown; Lead Free: Lead Free; ComponentLink1URL: https://datasheet.ciiva.com/2452/pyu-rc0402-51-rohs-l-6-2452608.pdf?src-supplier=Digi-Key; ComponentLink1Description: https://datasheet.ciiva.com/2452/pyu-rc0402-51-rohs-l-6-2452608.pdf?src-supplier=Digi-Key; ComponentLink2URL: https://datasheet.ciiva.com/11808/0900766b80c66297-11808195.pdf?src-supplier=RSComponents; ComponentLink2Description: https://datasheet.ciiva.com/11808/0900766b80c66297-11808195.pdf?src-supplier=RSComponents; ComponentLink3URL: https://datasheet.ciiva.com/2452/pyu-r-int-thick-7-2452609.pdf?src-supplier=Digi-Key; ComponentLink3Description: https://datasheet.ciiva.com/2452/pyu-r-int-thick-7-2452609.pdf?src-supplier=Digi-Key; ComponentLink4URL: https://datasheet.ciiva.com/22747/1018594-22747515.pdf?src-supplier=Element14; ComponentLink4Description: https://datasheet.ciiva.com/22747/1018594-22747515.pdf?src-supplier=Element14; ComponentLink5URL: https://datasheet.ciiva.com/7983/1018594-7983535.pdf?src-supplier=Element14; ComponentLink5Description: https://datasheet.ciiva.com/7983/1018594-7983535.pdf?src-supplier=Element14; ComponentLink6URL: https://datasheet.ciiva.com/2452/pyu-r-int-thick-7-2452610.pdf?src-supplier=Digi-Key; ComponentLink6Description: https://datasheet.ciiva.com/2452/pyu-r-int-thick-7-2452610.pdf?src-supplier=Digi-Key; ComponentLink7URL: https://datasheet.ciiva.com/8896/pyu-rc0402-51-rohs-l-6-8896201.pdf?src-supplier=Avnet; ComponentLink7Description: https://datasheet.ciiva.com/8896/pyu-rc0402-51-rohs-l-6-8896201.pdf?src-supplier=Avnet; ComponentLink8URL: https://datasheet.ciiva.com/28386/pyu-rc0402-51-rohs-l-6-28386633.pdf?src-supplier=Avnet+Europe; ComponentLink8Description: https://datasheet.ciiva.com/28386/pyu-rc0402-51-rohs-l-6-28386633.pdf?src-supplier=Avnet+Europe; ComponentLink9URL: https://datasheet.ciiva.com/15189/getdatasheetpartid-326379-15189533.pdf?src-supplier=Verical; ComponentLink9Description: https://datasheet.ciiva.com/15189/getdatasheetpartid-326379-15189533.pdf?src-supplier=Verical
R694 = Resistor: Manufacturer: Panasonic; Manufacturer Part Number: ERJ-2RKF1001X; Tolerance: 1%; Power Rating: 100mW; Temperature Coefficient: 100ppm/°C; Voltage Rating: 50V; Supplier 1: Digi-Key; Supplier Part Number 1: P1.00KLCT-ND; Stock 1: 6683975; Pricing 1: 1 = 0,10000, 10 = 0,05200, 100 = 0,02130, 1000 = 0,00958, 2500 = 0,00832, 5000 = 0,00687 (USD); RoHS: Yes; Mount: Surface Mount; Case/Package: 0402; Number of Pins: 2; Case Code (Imperial): 0402; Case Code (Metric): 1005; Contact Plating: Tin; Min Operating Temperature: -55°C; Max Operating Temperature: 155°C; Resistance: 1kR; Packaging: Tape and Reel; Composition: Thick Film; Termination: SMD/SMT; Package Quantity: 1; Military Standard: Not; Number of Terminations: 2; Max Power Dissipation: 100mW; Voltage Rating (DC): 50V; Features: Automotive AEC-Q200; Working Voltage: 50V; Length: 1mm; Height: 0.35mm; Width: 0.5mm; Depth: 0.5mm; Radiation Hardening: No; Lead Free: Lead Free; REACH SVHC: No SVHC; ComponentLink1URL: https://datasheet.ciiva.com/11821/0900766b80f80784-11821203.pdf?src-supplier=RSComponents; ComponentLink1Description: https://datasheet.ciiva.com/11821/0900766b80f80784-11821203.pdf?src-supplier=RSComponents; ComponentLink2URL: https://datasheet.ciiva.com/16767/70260748-16767559.pdf?src-supplier=Allied+Electronics; ComponentLink2Description: https://datasheet.ciiva.com/16767/70260748-16767559.pdf?src-supplier=Allied+Electronics; ComponentLink3URL: https://datasheet.ciiva.com/9198/aoa0000ce2-9198920.pdf?src-supplier=Avnet; ComponentLink3Description: https://datasheet.ciiva.com/9198/aoa0000ce2-9198920.pdf?src-supplier=Avnet; ComponentLink4URL: https://datasheet.ciiva.com/7942/aoa0000ce2-7942426.pdf?src-supplier=Element14; ComponentLink4Description: https://datasheet.ciiva.com/7942/aoa0000ce2-7942426.pdf?src-supplier=Element14; ComponentLink5URL: https://datasheet.ciiva.com/16771/70260748-16771979.pdf?src-supplier=Allied+Electronics; ComponentLink5Description: https://datasheet.ciiva.com/16771/70260748-16771979.pdf?src-supplier=Allied+Electronics; ComponentLink6URL: https://datasheet.ciiva.com/17215/aoa0000ce2-17215308.pdf?src-supplier=Avnet+Europe; ComponentLink6Description: https://datasheet.ciiva.com/17215/aoa0000ce2-17215308.pdf?src-supplier=Avnet+Europe; ComponentLink7URL: https://datasheet.ciiva.com/28532/1678782-28532109.pdf?src-supplier=Element14; ComponentLink7Description: https://datasheet.ciiva.com/28532/1678782-28532109.pdf?src-supplier=Element14; ComponentLink8URL: https://datasheet.ciiva.com/16523/aoa0000ce2-16523834.pdf?src-supplier=Avnet+Asia; ComponentLink8Description: https://datasheet.ciiva.com/16523/aoa0000ce2-16523834.pdf?src-supplier=Avnet+Asia; ComponentLink9URL: https://datasheet.ciiva.com/22673/1678782-22673916.pdf?src-supplier=Element14; ComponentLink9Description: https://datasheet.ciiva.com/22673/1678782-22673916.pdf?src-supplier=Element14
R695 = Resistor: RES SMD 100 OHM 1% 1/16W 0402; Manufacturer: Yageo; Manufacturer Part Number: RC0402FR-07100RL; Power Rating: 62.5mW; Voltage Rating: 50V; Temperature Coefficient: 100ppm/°C; Supplier 1: Digi-Key; Supplier Part Number 1: 311-100LRDKR-ND; RoHS: Yes; Category: Chip SMD Resistors; Stock 1: 42078262; Pricing 1: 1=0,10000, 10=0,01600, 100=0,00640, 1000=0,00289, 2500=0,00251, 5000=0,00207 (USD); Number of Pins: 2; Case Code (Imperial): 0402; Case Code (Metric): 1005; Min Operating Temperature: -55°C; Max Operating Temperature: 155°C; Tolerance: 1%; Resistance: 100R; Packaging: Tape and Reel; Termination: SMD/SMT; Composition: Thick Film; Military Standard: Not; Voltage Rating (DC): 50V; Length: 1mm; Height: 0.32mm; Depth: 0.5mm; Width: 0.5mm; REACH SVHC: No SVHC; Lead Free: Lead Free; ComponentLink1URL: https://datasheet.ciiva.com/7849/1784430-7849810.pdf?src-supplier=Element14; ComponentLink1Description: https://datasheet.ciiva.com/7849/1784430-7849810.pdf?src-supplier=Element14; ComponentLink2URL: https://datasheet.ciiva.com/11808/0900766b80c66297-11808765.pdf?src-supplier=RSComponents; ComponentLink2Description: https://datasheet.ciiva.com/11808/0900766b80c66297-11808765.pdf?src-supplier=RSComponents; ComponentLink3URL: https://datasheet.ciiva.com/12667/pyu-rc0402-51-rohs-l-6-r-12667957.pdf?src-supplier=Mouser; ComponentLink3Description: https://datasheet.ciiva.com/12667/pyu-rc0402-51-rohs-l-6-r-12667957.pdf?src-supplier=Mouser; ComponentLink4URL: https://datasheet.ciiva.com/16740/pyu-rc0402-51-rohs-l-6-r-16740566.pdf?src-supplier=Future+Electronics; ComponentLink4Description: https://datasheet.ciiva.com/16740/pyu-rc0402-51-rohs-l-6-r-16740566.pdf?src-supplier=Future+Electronics; ComponentLink5URL: https://datasheet.ciiva.com/15189/getdatasheetpartid-329466-15189335.pdf?src-supplier=Verical; ComponentLink5Description: https://datasheet.ciiva.com/15189/getdatasheetpartid-329466-15189335.pdf?src-supplier=Verical; ComponentLink6URL: https://datasheet.ciiva.com/28367/1018594-28367226.pdf?src-supplier=Element14; ComponentLink6Description: https://datasheet.ciiva.com/28367/1018594-28367226.pdf?src-supplier=Element14; ComponentLink7URL: https://datasheet.ciiva.com/22747/1018594-22747511.pdf?src-supplier=Element14; ComponentLink7Description: https://datasheet.ciiva.com/22747/1018594-22747511.pdf?src-supplier=Element14
U1 = FBVB900: FPGA Zynq UltraScale+ Family 192150 Cells 20nm Technology 0.85V 900-Pin FCBGA Tray; Manufacturer Part Number: XCZU4CG-1FBVB900E; Manufacturer: Xilinx; Peripherals: WDT,DMA; Interface: I2C,SPI,USB,Ethernet,MMC,SDIO,SD,UART,USART,EBI/EMI; Core Architecture: ARM; RAM Size: 256KB; Frequency: 500MHz; Number of I/Os: 204; Supplier 1: Mouser; Supplier Part Number 1: 217-CZU4CG-1FBVB900E; Stock 1: 3; Pricing 1: 1=0,00000, 5=1060,70000 (USD); RoHS: No; Case/Package: FCBGA; Min Operating Temperature: 0°C; Max Operating Temperature: 100°C; Packaging: Tray; ComponentLink1URL: https://www.xilinx.com/support/documentation/data_sheets/ds891-zynq-ultrascale-plus-overview.pdf?src-supplier=Digi-Key; ComponentLink1Description: https://www.xilinx.com/support/documentation/data_sheets/ds891-zynq-ultrascale-plus-overview.pdf?src-supplier=Digi-Key; ComponentLink2URL: https://www.xilinx.com/support/documentation/data_sheets/ds925-zynq-ultrascale-plus.pdf?src-supplier=Digi-Key; ComponentLink2Description: https://www.xilinx.com/support/documentation/data_sheets/ds925-zynq-ultrascale-plus.pdf?src-supplier=Digi-Key; Supplier 2: Avnet; Supplier 3: Digi-Key; Supplier Part Number 2: XCZU4CG-1FBVB900E; Supplier Part Number 3: XCZU4CG-1FBVB900E-ND